# Altium schematic sheet Sodonguyenly.SchDoc
size B; SheetNumber: 1; SheetTotal: 1
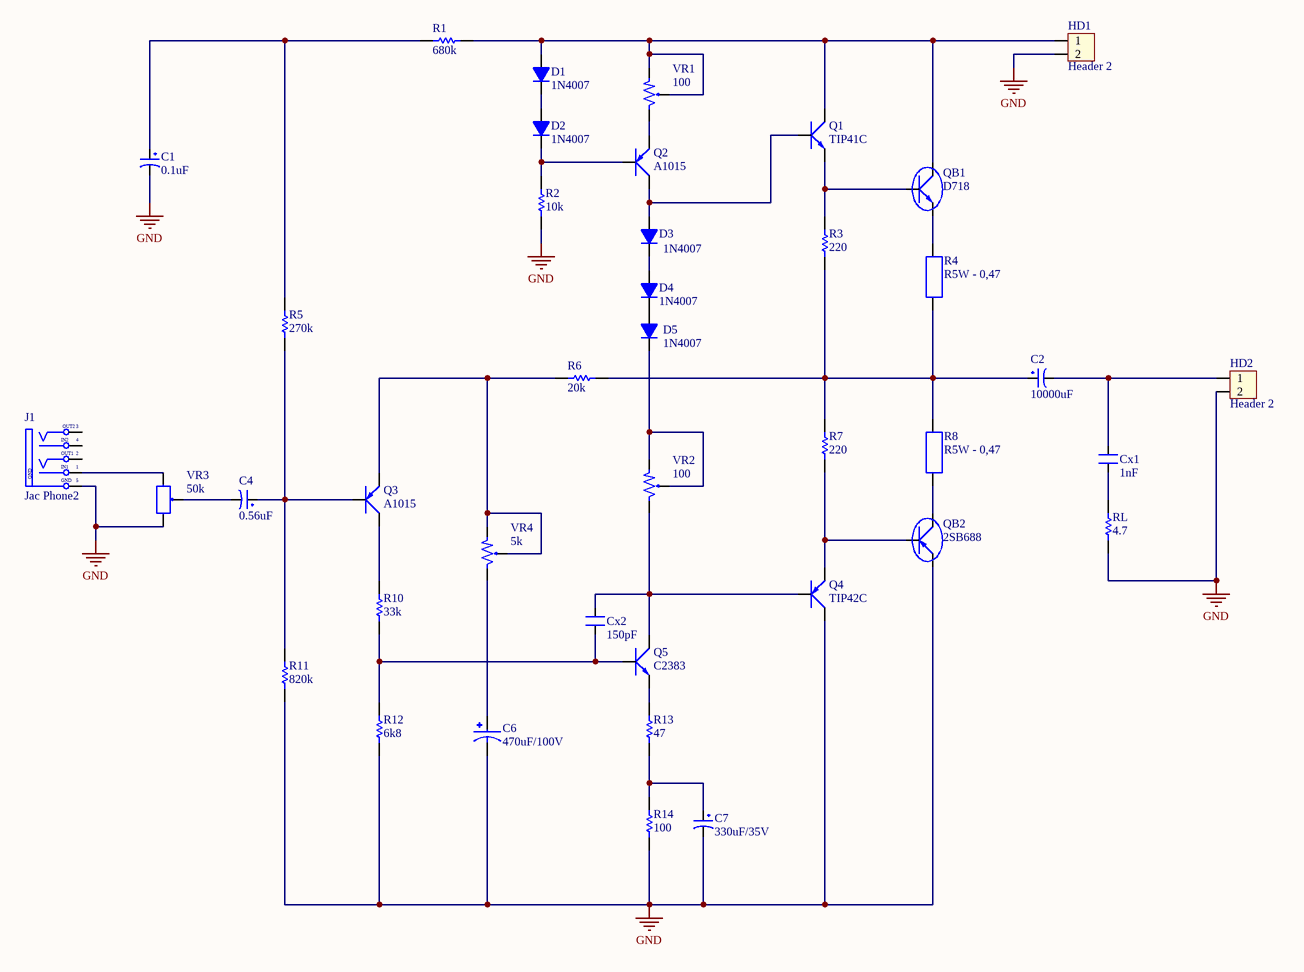
[diagram p0: Sodonguyenly.SchDoc]

## Parts
C1  0.1uF  [CP1/2]
C2  10000uF  [CP4/8.5]
C4  0.56uF  [CP1/2]
C6  470uF/100V  [CAPPRD750W80D1600H2500]
C7  330uF/35V  [CP1.5/3.4]
Cx1  1nF  [CN1]
Cx2  150pF  [CN1]
D1  1N4007  [D1A]
D2  1N4007  [D1A]
D3  1N4007  [D1A]
D4  1N4007  [D1A]
D5  1N4007  [D1A]
HD1  Header 2  [HED2]
HD2  Header 2  [HED2]
J1  Jac Phone2  [JacPhone2]
Q1  TIP41C  [QTO-220]
Q2  A1015  [QTO-92]
Q3  A1015  [QTO-92]
Q4  TIP42C  [QTO-220]
Q5  C2383  [QTO-92]
QB1  D718  [QTO-247]
QB2  2SB688  [TO247+LageHeatsink]
R1  value 680k  [R1/4W]  (hidden comment: Res1)
R2  value 10k  [R1/4W]  (hidden comment: Res1)
R3  value 220  [R1/4W]  (hidden comment: Res1)
R4  R5W - 0,47  [R5W]
R5  value 270k  [R1/4W]  (hidden comment: Res1)
R6  value 20k  [R1/4W]  (hidden comment: Res1)
R7  value 220  [R1/4W]  (hidden comment: Res1)
R8  R5W - 0,47  [R5W]
R10  value 33k  [R1/4W]  (hidden comment: Res1)
R11  value 820k  [R1/4W]  (hidden comment: Res1)
R12  value 6k8  [R1/4W]  (hidden comment: Res1)
R13  value 47  [R1/4W]  (hidden comment: Res1)
R14  value 100  [R1/4W]  (hidden comment: Res1)
RL  value 4.7  [R1/4W]  (hidden comment: Res1)
VR1  100  [VR1]
VR2  100  [VR1]
VR3  50k  [VR]
VR4  5k  [VR1]

## Nets
GND: C1.2 C6.N C7.2 HD1.2 HD2.2 J1.5(GND) Q4.2(C) QB2.3(E) R2.2 R11.1 R12.1 R14.2 RL.2 VR3.3
NetC1_1: C1.1 R1.2 R5.2
NetC2_1: C2.1 R3.2 R4.1 R6.1 R7.1 R8.2
NetC2_2: C2.2 Cx1.2 HD2.1
NetC4_1: C4.1 Q3.3(B) R5.1 R11.2
NetC4_2: C4.2 VR3.2
NetC6_P: C6.P VR4.3
NetC7_1: C7.1 R13.2 R14.1
NetCx1_1: Cx1.1 RL.1
NetCx2_1: Cx2.1 Q5.3(B) R10.1 R12.2
NetCx2_2: Cx2.2 Q4.1(B) Q5.2(C) VR2.3
NetD1_1: D1.1(A) HD1.1 Q1.2(C) QB1.2(C) R1.1 VR1.1 VR1.2
NetD1_2: D1.2(K) D2.1(A)
NetD2_2: D2.2(K) Q2.3(B) R2.1
NetD3_1: D3.1(A) Q1.1(B) Q2.2(C)
NetD3_2: D3.2(K) D4.1(A)
NetD4_2: D4.2(K) D5.1(A)
NetD5_2: D5.2(K) VR2.1 VR2.2
NetJ1_1: J1.1(S1) VR3.1
NetQ1_3: Q1.3(E) QB1.1(B) R3.1
NetQ2_1: Q2.1(E) VR1.3
NetQ3_1: Q3.1(E) R6.2 VR4.1 VR4.2
NetQ3_2: Q3.2(C) R10.2
NetQ4_3: Q4.3(E) QB2.1(B) R7.2
NetQ5_1: Q5.1(E) R13.1
NetQB1_3: QB1.3(E) R4.2
NetQB2_2: QB2.2(C) R8.1

Not connected (* = marked no-connect by the designer): J1 2(S1) 3(TN) 4(S)

## Notes on the sheet
- (in symbol Jac Phone2) OUT2; IN2; OUT1; IN1

## Library data of the parts
C1 C4 = CP1: Cap P  0,1uF < 22uF , 16 - 50V; Value: 10uF/50V; Description 1: 10 => 220uF/6,3V/10V - 10uF => 100uF/16V; Description 2: 0,1uF => 33uF/50V - 10uF => 22uF/63V; Description 3: 0,47uF => 10uF/100V
C2 = CP7: Cap 4700uF/50V; Value: 4700uF/50V
C6 = ECA2AHG471: 470ÂµF 100V Aluminum Electrolytic Capacitors Radial, Can 2000 Hrs @ 105Â°C; MF: Panasonic; SnapEDA_Link: https://www.snapeda.com/parts/ECA2AHG471/Panasonic/view-part/?ref=snap; Value: *; MP: ECA2AHG471; Availability: In Stock; Check_prices: https://www.snapeda.com/parts/ECA2AHG471/Panasonic/view-part/?ref=eda; Package: RADIAL-2 Panasonic; Price: None
C7 = CP3: Cap 100uF/35V - 470uF/16V; Value: 100uF/35V/50V; Description 1: 1000uF/6,3V - 470uF/16V - 330uF - 25V; Description 2: 220uF/35V - 100uF/50V - 63V - 4,7uF/200V; Description 3: 22uF => 33uF100V - 3,3uF => 4,7uF/250V; Description 4: 2,2uF =>3,3uF/350 - 2,2uF/400V - 1uF/450V
Cx1 Cx2 = CN1: Cap np  1pF - 472pF; Value: 100pF
D1-D5 = D1A: Diode 1A; Value: 1N4007
HD1 HD2 = Hed2: Header 2 (Green); Value: Header 2
J1 = Jac Phone2: Jac Phone Stereo; Creat by: VanDungEvn@Gmail.com
Q1 = TIP41C: NPN 2W, BCE; Value: TIP41C
Q2 Q3 = A1015: PNP 600mW, ECB; Value: A1015
Q4 = TIP42C: PNP 2W, BCE; Value: TIP42C
Q5 = NPN_ECB: P 600mW, ECB; Value: C1815
QB1 = D718: Transistor Power Supply; Value: D718
QB2 = 2SB688: Transistor Power Supply; Value: B688
R1-R3 R5-R7 R10-R14 RL = Res1_1: Resistor; Manufacturer: Generic Components; Class: Passive; Published: 08/06/2000; Publisher: Altium Hobart Technology Centre; SubClass: Resistor
R4 R8 = R5W: Resistor 5W; Value: R5W - 0,47R
VR1 VR2 VR4 = VR1: Var Resistor; Value: VR 10K
VR3 = VR: Var Resistor; Value: VR 10K